# Altium schematic sheet Controller-Sheet-3.SchDoc
size 420 x 297 mm; SheetNumber: 8; SheetTotal: 15
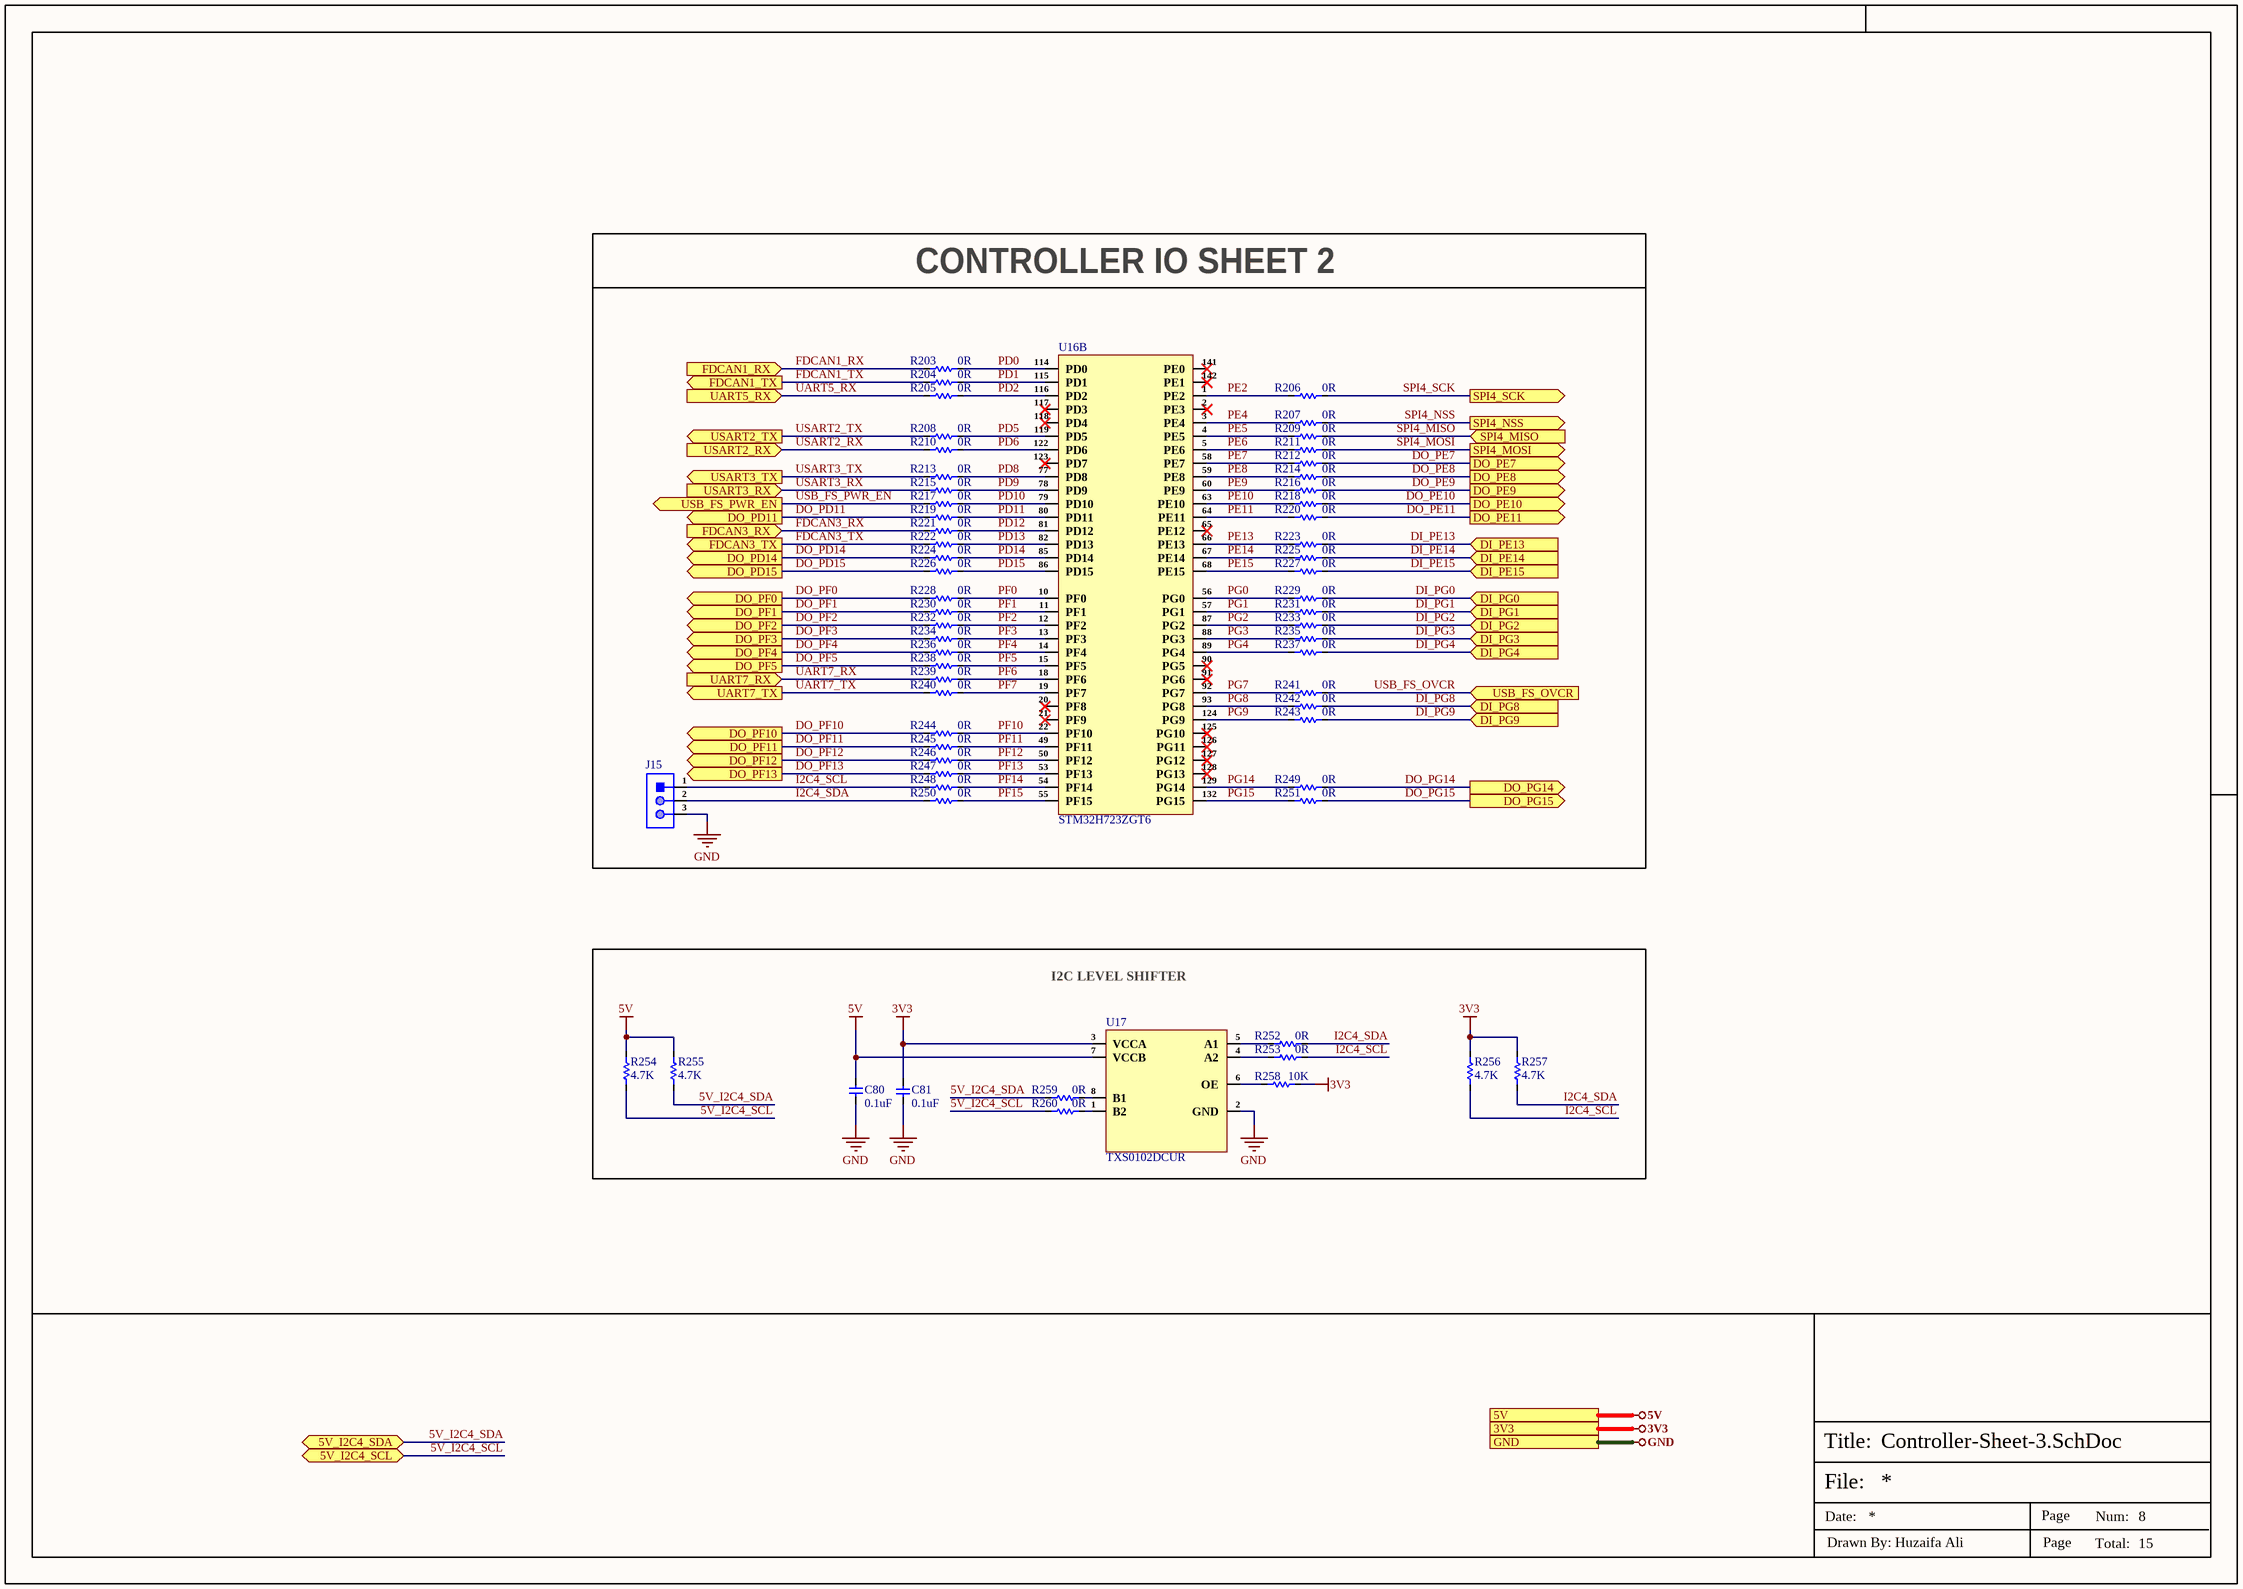
[diagram p0: Controller-Sheet-3.SchDoc]

## Parts
C80  0.1uF  [Cap-0402]
C81  0.1uF  [Cap-0402]
J15  X6511WV-03H-C60D30  [HDR1X3_]  (value not drawn)
R203  0R  [Res-0402]
R204  0R  [Res-0402]
R205  0R  [Res-0402]
R206  0R  [Res-0402]
R207  0R  [Res-0402]
R208  0R  [Res-0402]
R209  0R  [Res-0402]
R210  0R  [Res-0402]
R211  0R  [Res-0402]
R212  0R  [Res-0402]
R213  0R  [Res-0402]
R214  0R  [Res-0402]
R215  0R  [Res-0402]
R216  0R  [Res-0402]
R217  0R  [Res-0402]
R218  0R  [Res-0402]
R219  0R  [Res-0402]
R220  0R  [Res-0402]
R221  0R  [Res-0402]
R222  0R  [Res-0402]
R223  0R  [Res-0402]
R224  0R  [Res-0402]
R225  0R  [Res-0402]
R226  0R  [Res-0402]
R227  0R  [Res-0402]
R228  0R  [Res-0402]
R229  0R  [Res-0402]
R230  0R  [Res-0402]
R231  0R  [Res-0402]
R232  0R  [Res-0402]
R233  0R  [Res-0402]
R234  0R  [Res-0402]
R235  0R  [Res-0402]
R236  0R  [Res-0402]
R237  0R  [Res-0402]
R238  0R  [Res-0402]
R239  0R  [Res-0402]
R240  0R  [Res-0402]
R241  0R  [Res-0402]
R242  0R  [Res-0402]
R243  0R  [Res-0402]
R244  0R  [Res-0402]
R245  0R  [Res-0402]
R246  0R  [Res-0402]
R247  0R  [Res-0402]
R248  0R  [Res-0402]
R249  0R  [Res-0402]
R250  0R  [Res-0402]
R251  0R  [Res-0402]
R252  0R  [Res-0402]
R253  0R  [Res-0402]
R254  4.7K  [Res-0402]
R255  4.7K  [Res-0402]
R256  4.7K  [Res-0402]
R257  4.7K  [Res-0402]
R258  10K  [Res-0402]
R259  0R  [Res-0402]
R260  0R  [Res-0402]
U16  STM32H723ZGT6  [LQFP-144(20x20)]  (part B of 3)
U17  TXS0102DCUR  [VSSOP-8(3.1x2.1)]

## Blocks framed on the sheet
CONTROLLER IO SHEET 2: J15 R203-R251 U16
I2C LEVEL SHIFTER: C80 C81 R252-R260 U17

## Ports
3V3 (see Top-Sheet[3B], CAN-Sheet[5D], Controller-Sheet-1[4D], Controller-Sheet-2[4D], DIOs-Lights-Sensors-Sheet[4D], Display-Sheet[5D], ESP32_Sheet[6D], EtherCAT-Sheet[1D], Ethernet-Sheet[5D], Power-Sheet[4D], RS232-Sheet[5D], RS485-Sheet[5D], STM32-USB-Sheet[4D]), 5V (see Top-Sheet[3B], Analog-AIO-Sheet[5D], CAN-Sheet[5D], Controller-Sheet-2[4D], DIOs-Lights-Sensors-Sheet[4D], Display-Sheet[5D], Power-Sheet[4D], RS232-Sheet[5D], RS485-Sheet[5D], STM32-USB-Sheet[4D]), 5V_I2C4_SCL (bidir, see Top-Sheet[3C]), 5V_I2C4_SDA (bidir, see Top-Sheet[3C]), DI_PE13 (in, see Top-Sheet[4C]), DI_PE14 (in, see Top-Sheet[4C]), DI_PE15 (in, see Top-Sheet[4C]), DI_PG0 (in, see Top-Sheet[4C]), DI_PG1 (in, see Top-Sheet[4C]), DI_PG2 (in, see Top-Sheet[4C]), DI_PG3 (in, see Top-Sheet[4C]), DI_PG4 (in, see Top-Sheet[4C]), DI_PG8 (in, see Top-Sheet[4B]), DI_PG9 (in, see Top-Sheet[4B]), DO_PD11 (out, see Top-Sheet[4C]), DO_PD14 (out, see Top-Sheet[4C]), DO_PD15 (out, see Top-Sheet[4C]), DO_PE7 (out, see Top-Sheet[3C]), DO_PE8 (out, see Top-Sheet[3C]), DO_PE9 (out, see Top-Sheet[3C]), DO_PE10 (out, see Top-Sheet[3C]), DO_PE11 (out, see Top-Sheet[3C]), DO_PF0 (out, see Top-Sheet[3C]), DO_PF1 (out, see Top-Sheet[3C]), DO_PF2 (out, see Top-Sheet[3C]), DO_PF3 (out, see Top-Sheet[3D]), DO_PF4 (out, see Top-Sheet[3D]), DO_PF5 (out, see Top-Sheet[3D]), DO_PF10 (out, see Top-Sheet[3D]), DO_PF11 (out, see Top-Sheet[3D]), DO_PF12 (out, see Top-Sheet[3D]), DO_PF13 (out, see Top-Sheet[4C]), DO_PG14 (out, see Top-Sheet[4B]), DO_PG15 (out, see Top-Sheet[4B]), FDCAN1_RX (in, see Top-Sheet[3C]), FDCAN1_TX (out, see Top-Sheet[3C]), FDCAN3_RX (in, see Top-Sheet[3D]), FDCAN3_TX (out, see Top-Sheet[3D]), GND (see Top-Sheet[3B], Analog-AIO-Sheet[5D], CAN-Sheet[6D], Controller-Sheet-1[4D], Controller-Sheet-2[4D], DIOs-Lights-Sensors-Sheet[4D], Display-Sheet[5D], ESP32_Sheet[6D], EtherCAT-Sheet[1D], Ethernet-Sheet[5D], Power-Sheet[4D], RS232-Sheet[5D], RS485-Sheet[5D], STM32-USB-Sheet[4D]), SPI4_MISO (in, see Top-Sheet[3C]), SPI4_MOSI (out, see Top-Sheet[3B]), SPI4_NSS (out, see Top-Sheet[3B]), SPI4_SCK (out, see Top-Sheet[3B]), UART5_RX (in, see Top-Sheet[3D]), UART7_RX (in, see Top-Sheet[3B]), UART7_TX (out, see Top-Sheet[3B]), USART2_RX (in, see Top-Sheet[4B]), USART2_TX (out, see Top-Sheet[4B]), USART3_RX (in, see Top-Sheet[3D]), USART3_TX (out, see Top-Sheet[3D]), USB_FS_OVCR (in, see Top-Sheet[4C], STM32-USB-Sheet[1D]), USB_FS_PWR_EN (out, see Top-Sheet[4C], STM32-USB-Sheet[1D])

## Nets
3V3: C81.2 R256.2 R257.2 R258.2 U17.3(VCCA) ; port 3V3
5V: C80.1 R254.2 R255.2 U17.7(VCCB) ; port 5V
GND: C80.2 C81.1 J15.3 U17.2(GND) ; port GND
5V_I2C4_SCL: R254.1 R260.1 ; port 5V_I2C4_SCL
5V_I2C4_SDA: R255.1 R259.1 ; port 5V_I2C4_SDA
DI_PE13: R223.1 ; port DI_PE13
DI_PE14: R225.1 ; port DI_PE14
DI_PE15: R227.1 ; port DI_PE15
DI_PG0: R229.1 ; port DI_PG0
DI_PG1: R231.1 ; port DI_PG1
DI_PG2: R233.1 ; port DI_PG2
DI_PG3: R235.1 ; port DI_PG3
DI_PG4: R237.1 ; port DI_PG4
DI_PG8: R242.1 ; port DI_PG8
DI_PG9: R243.1 ; port DI_PG9
DO_PD11: R219.2 ; port DO_PD11
DO_PD14: R224.2 ; port DO_PD14
DO_PD15: R226.2 ; port DO_PD15
DO_PE7: R212.1 ; port DO_PE7
DO_PE8: R214.1 ; port DO_PE8
DO_PE9: R216.1 ; port DO_PE9
DO_PE10: R218.1 ; port DO_PE10
DO_PE11: R220.1 ; port DO_PE11
DO_PF0: R228.2 ; port DO_PF0
DO_PF1: R230.2 ; port DO_PF1
DO_PF2: R232.2 ; port DO_PF2
DO_PF3: R234.2 ; port DO_PF3
DO_PF4: R236.2 ; port DO_PF4
DO_PF5: R238.2 ; port DO_PF5
DO_PF10: R244.2 ; port DO_PF10
DO_PF11: R245.2 ; port DO_PF11
DO_PF12: R246.2 ; port DO_PF12
DO_PF13: R247.2 ; port DO_PF13
DO_PG14: R249.1 ; port DO_PG14
DO_PG15: R251.1 ; port DO_PG15
FDCAN1_RX: R203.2 ; port FDCAN1_RX
FDCAN1_TX: R204.2 ; port FDCAN1_TX
FDCAN3_RX: R221.2 ; port FDCAN3_RX
FDCAN3_TX: R222.2 ; port FDCAN3_TX
I2C4_SCL: J15.1 R248.2 R253.2 R256.1
I2C4_SDA: J15.2 R250.2 R252.2 R257.1
PD0: R203.1 U16.114(PD0)
PD1: R204.1 U16.115(PD1)
PD2: R205.1 U16.116(PD2)
PD5: R208.1 U16.119(PD5)
PD6: R210.1 U16.122(PD6)
PD8: R213.1 U16.77(PD8)
PD9: R215.1 U16.78(PD9)
PD10: R217.1 U16.79(PD10)
PD11: R219.1 U16.80(PD11)
PD12: R221.1 U16.81(PD12)
PD13: R222.1 U16.82(PD13)
PD14: R224.1 U16.85(PD14)
PD15: R226.1 U16.86(PD15)
PE2: R206.2 U16.1(PE2)
PE4: R207.2 U16.3(PE4)
PE5: R209.2 U16.4(PE5)
PE6: R211.2 U16.5(PE6)
PE7: R212.2 U16.58(PE7)
PE8: R214.2 U16.59(PE8)
PE9: R216.2 U16.60(PE9)
PE10: R218.2 U16.63(PE10)
PE11: R220.2 U16.64(PE11)
PE13: R223.2 U16.66(PE13)
PE14: R225.2 U16.67(PE14)
PE15: R227.2 U16.68(PE15)
PF0: R228.1 U16.10(PF0)
PF1: R230.1 U16.11(PF1)
PF2: R232.1 U16.12(PF2)
PF3: R234.1 U16.13(PF3)
PF4: R236.1 U16.14(PF4)
PF5: R238.1 U16.15(PF5)
PF6: R239.1 U16.18(PF6)
PF7: R240.1 U16.19(PF7)
PF10: R244.1 U16.22(PF10)
PF11: R245.1 U16.49(PF11)
PF12: R246.1 U16.50(PF12)
PF13: R247.1 U16.53(PF13)
PF14: R248.1 U16.54(PF14)
PF15: R250.1 U16.55(PF15)
PG0: R229.2 U16.56(PG0)
PG1: R231.2 U16.57(PG1)
PG2: R233.2 U16.87(PG2)
PG3: R235.2 U16.88(PG3)
PG4: R237.2 U16.89(PG4)
PG7: R241.2 U16.92(PG7)
PG8: R242.2 U16.93(PG8)
PG9: R243.2 U16.124(PG9)
PG14: R249.2 U16.129(PG14)
PG15: R251.2 U16.132(PG15)
SPI4_MISO: R209.1 ; port SPI4_MISO
SPI4_MOSI: R211.1 ; port SPI4_MOSI
SPI4_NSS: R207.1 ; port SPI4_NSS
SPI4_SCK: R206.1 ; port SPI4_SCK
UART5_RX: R205.2 ; port UART5_RX
UART7_RX: R239.2 ; port UART7_RX
UART7_TX: R240.2 ; port UART7_TX
USART2_RX: R210.2 ; port USART2_RX
USART2_TX: R208.2 ; port USART2_TX
USART3_RX: R215.2 ; port USART3_RX
USART3_TX: R213.2 ; port USART3_TX
USB_FS_OVCR: R241.1 ; port USB_FS_OVCR
USB_FS_PWR_EN: R217.2 ; port USB_FS_PWR_EN
NetR252_1: R252.1 U17.5(A1)
NetR253_1: R253.1 U17.4(A2)
NetR258_1: R258.1 U17.6(OE)
NetR259_2: R259.2 U17.8(B1)
NetR260_2: R260.2 U17.1(B2)

Not connected (* = marked no-connect by the designer): U16 2(PE3)* 20(PF8)* 21(PF9)* 65(PE12)* 90(PG5)* 91(PG6)* 117(PD3)* 118(PD4)* 123(PD7)* 125(PG10)* 126(PG11)* 127(PG12)* 128(PG13)* 141(PE0)* 142(PE1)*

## Notes on the sheet
- File:
- Title:
- Date:
- Page
- Num:
- Total:
- Drawn By: Huzaifa Ali

## Library data of the parts
C80 C81 = CC0402JRX7R7BB104: CAP CER 0.1UF 16V X7R 0402; Manufacturer: Yageo; Material: 4241ConductorMaterial; Value: 100nF; Tolerance: 5%; Item Type: Capacitor; Supplier: Digikey; Supplier Part Number: 311-1676-1-ND; Manufacturer Part Number: CC0402JRX7R7BB104; RoHS: Yes; Category: Ceramic Capacitors; Stock: 1659111; Pricing: 1=0.1, 10=0.046, 50=0.0262, 100=0.0203, 500=0.01528, 1000=0.012, 2500=0.01091, 5000=0.01004 (USD); Mounting Technology: Surface Mount; Case/Package: 0402; Case Code (Metric): 1005; Case Code (Imperial): 0402; Min Operating Temperature: -55°C; Max Operating Temperature: 125°C; Dielectric: X7R; Packaging: Tape and Reel; Package Quantity: 10000; Voltage Rating (DC): 16V; Voltage Rating: 16V; Series: CC; Construction: Flat; Length: 0.039inch; Width: 0.02inch; Height: 0.5mm; Thickness: 0.022inch; Lead Free: Lead Free; Halogen Free: Halogen Free; RoHS Compliant: Yes; ComponentLink1URL: https://datasheet.ciiva.com/13210/upy-gphc-x7r-6-3v-to-50v-8-12304-13210152.pdf?src-supplier=Mouser; ComponentLink1Description: https://datasheet.ciiva.com/13210/upy-gphc-x7r-6-3v-to-50v-8-12304-13210152.pdf?src-supplier=Mouser; LCSC Part Number: C541464
J15 = X6511WV-03H-C60D30: Gold 250V 3A Straight Square Pins 2.5mm 3P 260℃ 6mm -40℃~+105℃ 3mm 2.54mm Plugin Black Brass 1x3P Plugin,P=2.54mm Pin Headers ROHS; Manufacturer: XKB; Item Type: Male Header; Manufacturer Part Number: X6511WV-03H-C60D30; Package: Plugin,P=2.54mm; LCSC Part Number: C706875; ComponentLink1Description: LCSC; ComponentLink1URL: https://www.lcsc.com/product-detail/Pin-Headers_XKB-Connectivity-X6511WV-03H-C60D30_C706875.html
R203-R253 R259 R260 = RC0402FR-070RL: RES 0 OHM JUMPER 1/16W 0402; Manufacturer: Yageo; Item Type: Resistors; Tolerance: 1%; Power Rating: 62.5mW; Voltage Rating: 50V; Temperature Coefficient: 200ppm/°C; Max Power Dissipation: 63mW; Supplier 1: Mouser; Manufacturer Part Number: RC0402FR-070RL; RoHS: Yes; Stock 1: 8556842; Pricing 1: 1=0.10000, 10=0.01400, 50=0.01400, 100=0.00600, 1000=0.00300, 5000=0.00200, 10000=0.00100 (USD); Mount: Surface Mount; Case/Package: 0402; Contact Plating: Tin,Matte; Case Code (Imperial): 0402; Case Code (Metric): 1005; Size Code: 0402; Min Operating Temperature: -55°C; Max Operating Temperature: 155°C; Resistance: 0R; Resistor Type: Thick Film; Packaging: Tape and Reel; Termination: SMD/SMT; Features: Moisture Resistant; Series: RC; Number of Terminations: 2; Length: 1mm; Width: 0.5mm; Height: 0.35mm; Radiation Hardening: No; Lead Free: Lead Free; RoHS Compliant: Yes; ComponentLink1URL: https://datasheet.ciiva.com/8896/pyu-rc0402-51-rohs-l-6-8896149.pdf?src-supplier=Avnet; ComponentLink1Description: https://datasheet.ciiva.com/8896/pyu-rc0402-51-rohs-l-6-8896149.pdf?src-supplier=Avnet; ComponentLink2URL: https://datasheet.ciiva.com/16790/pyu-rc0402-51-rohs-l-6-r-16790444.pdf?src-supplier=Future+Electronics; ComponentLink2Description: https://datasheet.ciiva.com/16790/pyu-rc0402-51-rohs-l-6-r-16790444.pdf?src-supplier=Future+Electronics; Supplier Part Number 1: 603-RC0402FR-070RL; LCSC Part Number: C106231
R254-R257 = RC0402FR-074K7L: RES 4.7K OHM 1% 1/16W 0402; Manufacturer: Yageo; Voltage Rating (DC): 50V; Power Rating: 62.5mW; Resistance: 4.7kR; Temperature Coefficient: 100ppm/°C; Max Power Dissipation: 63mW; Item Type: Resistor; Supplier 1: Avnet; Manufacturer Part Number: RC0402FR-074K7L; RoHS: Yes; Category: Chip SMD Resistors; Stock 1: 2420000; Pricing 1: 10000=0.00085 (USD); Case/Package: 0402; Number of Pins: 2; Case Code (Imperial): 0402; Case Code (Metric): 1005; Size Code: 0402; Min Operating Temperature: -55°C; Max Operating Temperature: 155°C; Tolerance: 1%; Voltage Rating: 50V; Packaging: Tape and Reel; Resistor Type: Thick Film; Termination: SMD/SMT; Features: Moisture Resistant; Series: RC; Number of Terminations: 2; Resistance Tolerance: 1%; Construction: Rectangular; Length: 1mm; Width: 0.5mm; Height: 0.32mm; Depth: 0.5mm; Height - Seated (Max): 0.016inch; RoHS Compliant: Yes; Reach SVHC Compliant: Yes; Military Standard: Not; Lead Free: Lead Free; ComponentLink1URL: https://datasheet.ciiva.com/22661/1686128-22661342.pdf?src-supplier=Element14; ComponentLink1Description: https://datasheet.ciiva.com/22661/1686128-22661342.pdf?src-supplier=Element14; ComponentLink2URL: https://datasheet.ciiva.com/7850/1018594-7850022.pdf?src-supplier=Element14; ComponentLink2Description: https://datasheet.ciiva.com/7850/1018594-7850022.pdf?src-supplier=Element14; ComponentLink3URL: https://datasheet.ciiva.com/7850/1018594-7850023.pdf?src-supplier=Element14; ComponentLink3Description: https://datasheet.ciiva.com/7850/1018594-7850023.pdf?src-supplier=Element14; ComponentLink4URL: https://datasheet.ciiva.com/15215/getdatasheetpartid-328119-15215035.pdf?src-supplier=Verical; ComponentLink4Description: https://datasheet.ciiva.com/15215/getdatasheetpartid-328119-15215035.pdf?src-supplier=Verical; Supplier Part Number 1: RC0402FR-074K7L; LCSC Part Number: C105871
R258 = RC0402FR-0710KL: RES 10K OHM 1% 1/16W 0402; Manufacturer: Yageo; Resistance: 10kR; Voltage Rating (DC): 50V; Temperature Coefficient: 100ppm/°C; Power Rating: 62.5mW; Max Power Dissipation: 63mW; Item Type: Resistor; Supplier 1: Mouser; Manufacturer Part Number: RC0402FR-0710KL; RoHS: Yes; Category: Chip SMD Resistors; Stock 1: 18648329; Pricing 1: 1=0.10000, 10=0.01400, 50=0.01400, 100=0.00500, 1000=0.00300, 10000=0.00200 (USD); Case/Package: 0402; Number of Pins: 2; Case Code (Imperial): 0402; Case Code (Metric): 1005; Min Operating Temperature: -55°C; Max Operating Temperature: 155°C; Resistor Type: Thick Film; Tolerance: 1%; Packaging: Tape and Reel; Voltage Rating: 50V; Termination: SMD/SMT; Working Voltage: 50V; Number of Terminations: 2; Features: Moisture Resistant; Series: RC; Resistance Tolerance: 1%; Construction: Rectangular; Length: 1mm; Width: 0.5mm; Height: 0.32mm; Depth: 0.5mm; Lead Pitch: 0.2mm; REACH SVHC: No SVHC; Lead Free: Lead Free; RoHS Compliant: Yes; Military Standard: Not; ComponentLink1URL: https://datasheet.ciiva.com/7660/38568-7660787.pdf?src-supplier=Element14; ComponentLink1Description: https://datasheet.ciiva.com/7660/38568-7660787.pdf?src-supplier=Element14; ComponentLink2URL: https://datasheet.ciiva.com/7849/1686128-7849814.pdf?src-supplier=Element14; ComponentLink2Description: https://datasheet.ciiva.com/7849/1686128-7849814.pdf?src-supplier=Element14; ComponentLink3URL: https://datasheet.ciiva.com/7983/1018594-7983486.pdf?src-supplier=Element14; ComponentLink3Description: https://datasheet.ciiva.com/7983/1018594-7983486.pdf?src-supplier=Element14; ComponentLink4URL: https://datasheet.ciiva.com/22747/1018594-22747512.pdf?src-supplier=Element14; ComponentLink4Description: https://datasheet.ciiva.com/22747/1018594-22747512.pdf?src-supplier=Element14; ComponentLink5URL: https://datasheet.ciiva.com/12667/pyu-rc0402-51-rohs-l-6-r-12667067.pdf?src-supplier=Mouser; ComponentLink5Description: https://datasheet.ciiva.com/12667/pyu-rc0402-51-rohs-l-6-r-12667067.pdf?src-supplier=Mouser; ComponentLink6URL: https://datasheet.ciiva.com/7849/1784430-7849813.pdf?src-supplier=Element14; ComponentLink6Description: https://datasheet.ciiva.com/7849/1784430-7849813.pdf?src-supplier=Element14; ComponentLink7URL: https://datasheet.ciiva.com/7849/1784430-7849815.pdf?src-supplier=Element14; ComponentLink7Description: https://datasheet.ciiva.com/7849/1784430-7849815.pdf?src-supplier=Element14; Supplier Part Number 1: 603-RC0402FR-0710KL; LCSC Part Number: C60490
U16 = STM32H723ZGT6: IC MCU 32BIT 1MB FLASH 144LQFP; Manufacturer: STMicroelectronics; Interface: 39,40,224,1514,1515,1518,1532,1533Interface; Memory Format: 4498,11064MemoryType; Data Bus Width: 32b; Frequency: 550MHz; Max Supply Voltage: 3.6V; Min Supply Voltage: 1.62V; Nominal Supply Current: 4uA; Number of A/D Converters: 1NUMBER; Number of ADC Channels: 16NUMBER; Number of I2C Channels: 5NUMBER; Number of I/Os: 112NUMBER; Number of SPI Channels: 6NUMBER; Number of Timers/Counters: 4NUMBER; RAM Size: 564KB; Supplier: Future Electronics; LCSC Part Number: C730146; Manufacturer Part Number: STM32H723ZGT6; RoHS: No; Item Type: IC; Stock: 4380; Pricing: 60=7.31, 120=7.27, 180=7.25, 240=7.23, 300=7.18 (USD); Min Operating Temperature: -40°C; Max Operating Temperature: 85°C; Density: 1MB; Memory Size: 1MB; Number of Ethernet Channels: 1NUMBER; Number of UART Channels: 6NUMBER; Number of USB Channels: 1NUMBER; Height: 1.6mm
U17 = TXS0102DCUR: IC TRANSLTR BIDIRECTIONAL 8VSSOP; Manufacturer: Texas Instruments; Number of Outputs: 2NUMBER; Number of Inputs: 2; Nominal Supply Current: 14.4uA; Output Current: 1A; Min Supply Voltage: 1.65V; Max Supply Voltage: 5.5V; Data Rate: 24Mbps; Propagation Delay: 4.6ns; Logic Function: Translator; Turn-On Delay Time: 260ns; High Level Output Current: -20uA; Low Level Output Current: 1mA; Number of Circuits: 1; Supplier: Mouser; Supplier Part Number: 595-TXS0102DCUR; Manufacturer Part Number: TXS0102DCUR; RoHS: Yes; Category: Voltage Level Shifters; Stock: 149802; Pricing: 1=0.89, 10=0.739, 50=0.739, 100=0.561, 1000=0.383, 10000=0.313 (USD); Case/Package: VSSOP; Pins: 8; Weight: 0.000339oz; Min Operating Temperature: -40°C; Max Operating Temperature: 85°C; Package Quantity: 3000; Number of Channels: 2; Packaging: Tape and Reel; Number of Bits: 2; Quiescent Current: 14.4uA; Series: -; Channel Type: Bidirectional; Length: 2.3mm; Width: 2mm; Height: 900um; Thickness: 850um; Radiation Hardening: No; Reach SVHC Compliant: No; Lead Free: Lead Free; RoHS Compliant: Yes; ComponentLink1URL: https://datasheet.ciiva.com/22653/1846850-22653373.pdf?src-supplier=Farnell; ComponentLink1Description: https://datasheet.ciiva.com/22653/1846850-22653373.pdf?src-supplier=Farnell; ComponentLink2URL: https://datasheet.ciiva.com/15096/getdatasheetpartid-118249-15096172.pdf?src-supplier=Verical; ComponentLink2Description: https://datasheet.ciiva.com/15096/getdatasheetpartid-118249-15096172.pdf?src-supplier=Verical; ComponentLink3URL: https://datasheet.ciiva.com/1508/1857232-1508821.pdf?src-supplier=Element14; ComponentLink3Description: https://datasheet.ciiva.com/1508/1857232-1508821.pdf?src-supplier=Element14; ComponentLink4URL: https://datasheet.ciiva.com/28499/1863639-28499676.pdf?src-supplier=Element14; ComponentLink4Description: https://datasheet.ciiva.com/28499/1863639-28499676.pdf?src-supplier=Element14; ComponentLink5URL: https://datasheet.ciiva.com/46395/1863639-46395871.pdf?src-supplier=Element14; ComponentLink5Description: https://datasheet.ciiva.com/46395/1863639-46395871.pdf?src-supplier=Element14; ComponentLink6URL: https://datasheet.ciiva.com/1899/txs0102-1899369.pdf?src-supplier=Digikey; ComponentLink6Description: https://datasheet.ciiva.com/1899/txs0102-1899369.pdf?src-supplier=Digikey; ComponentLink7URL: https://datasheet.ciiva.com/1899/txs0102-1899368.pdf?src-supplier=Digikey; ComponentLink7Description: https://datasheet.ciiva.com/1899/txs0102-1899368.pdf?src-supplier=Digikey; ComponentLink8URL: https://datasheet.ciiva.com/1899/txs0102-1899370.pdf?src-supplier=Digikey; ComponentLink8Description: https://datasheet.ciiva.com/1899/txs0102-1899370.pdf?src-supplier=Digikey; ComponentLink9URL: https://datasheet.ciiva.com/14287/txs0102-14287516.pdf?src-supplier=Avnet; ComponentLink9Description: https://datasheet.ciiva.com/14287/txs0102-14287516.pdf?src-supplier=Avnet; ComponentLink10URL: https://datasheet.ciiva.com/14287/txs0102-14287518.pdf?src-supplier=Avnet; ComponentLink10Description: https://datasheet.ciiva.com/14287/txs0102-14287518.pdf?src-supplier=Avnet; LCSC Part Number: C53434; Item Type: IC